# Altium project datalogger.PrjPcb (part 1 of 2)
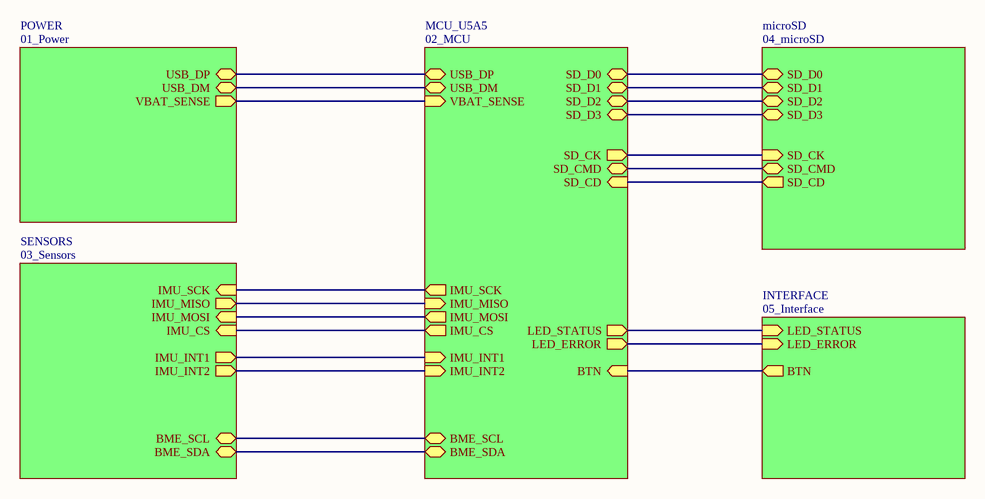
[diagram p0: 00_Top.SchDoc]
6 sheets, 74 parts. Net scope: hierarchical (ports join the sheet entries above them; power ports are global).
Board file: PCB_A1.PcbDoc
Sheets:
  00_Top.SchDoc
    MCU_U5A5 = 02_MCU.SchDoc
    microSD = 04_microSD.SchDoc
    INTERFACE = 05_Interface.SchDoc
    SENSORS = 03_Sensors.SchDoc
    POWER = 01_Power.SchDoc

## Sheet 00_Top.SchDoc
size A4; SheetNumber: 1; SheetTotal: 6

### Sub-sheets
INTERFACE = 05_Interface: LED_STATUS (in), LED_ERROR (in), BTN (out)
MCU_U5A5 = 02_MCU: LED_STATUS (out), LED_ERROR (out), BTN (in), SD_D0 (bidir), SD_D1 (bidir), SD_D2 (bidir), SD_D3 (bidir), SD_CK (out), SD_CMD (bidir), SD_CD (in), BME_SDA (bidir), BME_SCL (bidir), USB_DP (bidir), USB_DM (bidir), VBAT_SENSE (in), IMU_SCK (out), IMU_MISO (in), IMU_MOSI (out), IMU_CS (out), IMU_INT1 (in), IMU_INT2 (in)
microSD = 04_microSD: SD_D0 (bidir), SD_D1 (bidir), SD_D2 (bidir), SD_D3 (bidir), SD_CK (in), SD_CMD (bidir), SD_CD (out)
POWER = 01_Power: USB_DP (bidir), USB_DM (bidir), VBAT_SENSE (out)
SENSORS = 03_Sensors: BME_SDA (bidir), BME_SCL (bidir), IMU_INT2 (out), IMU_INT1 (out), IMU_CS (in), IMU_MOSI (in), IMU_SCK (in), IMU_MISO (out)

### Nets
BME_SCL: sheet MCU_U5A5/BME_SCL, sheet SENSORS/BME_SCL
BME_SDA: sheet MCU_U5A5/BME_SDA, sheet SENSORS/BME_SDA
BTN: sheet MCU_U5A5/BTN, sheet INTERFACE/BTN
IMU_CS: sheet MCU_U5A5/IMU_CS, sheet SENSORS/IMU_CS
IMU_INT1: sheet MCU_U5A5/IMU_INT1, sheet SENSORS/IMU_INT1
IMU_INT2: sheet MCU_U5A5/IMU_INT2, sheet SENSORS/IMU_INT2
IMU_MISO: sheet MCU_U5A5/IMU_MISO, sheet SENSORS/IMU_MISO
IMU_MOSI: sheet MCU_U5A5/IMU_MOSI, sheet SENSORS/IMU_MOSI
IMU_SCK: sheet MCU_U5A5/IMU_SCK, sheet SENSORS/IMU_SCK
LED_ERROR: sheet MCU_U5A5/LED_ERROR, sheet INTERFACE/LED_ERROR
LED_STATUS: sheet MCU_U5A5/LED_STATUS, sheet INTERFACE/LED_STATUS
SD_CD: sheet MCU_U5A5/SD_CD, sheet microSD/SD_CD
SD_CK: sheet MCU_U5A5/SD_CK, sheet microSD/SD_CK
SD_CMD: sheet MCU_U5A5/SD_CMD, sheet microSD/SD_CMD
SD_D0: sheet MCU_U5A5/SD_D0, sheet microSD/SD_D0
SD_D1: sheet MCU_U5A5/SD_D1, sheet microSD/SD_D1
SD_D2: sheet MCU_U5A5/SD_D2, sheet microSD/SD_D2
SD_D3: sheet MCU_U5A5/SD_D3, sheet microSD/SD_D3
USB_DM: sheet MCU_U5A5/USB_DM, sheet POWER/USB_DM
USB_DP: sheet MCU_U5A5/USB_DP, sheet POWER/USB_DP
VBAT_SENSE: sheet MCU_U5A5/VBAT_SENSE, sheet POWER/VBAT_SENSE

## Sheet 02_MCU.SchDoc
size A4; SheetNumber: 3; SheetTotal: 6
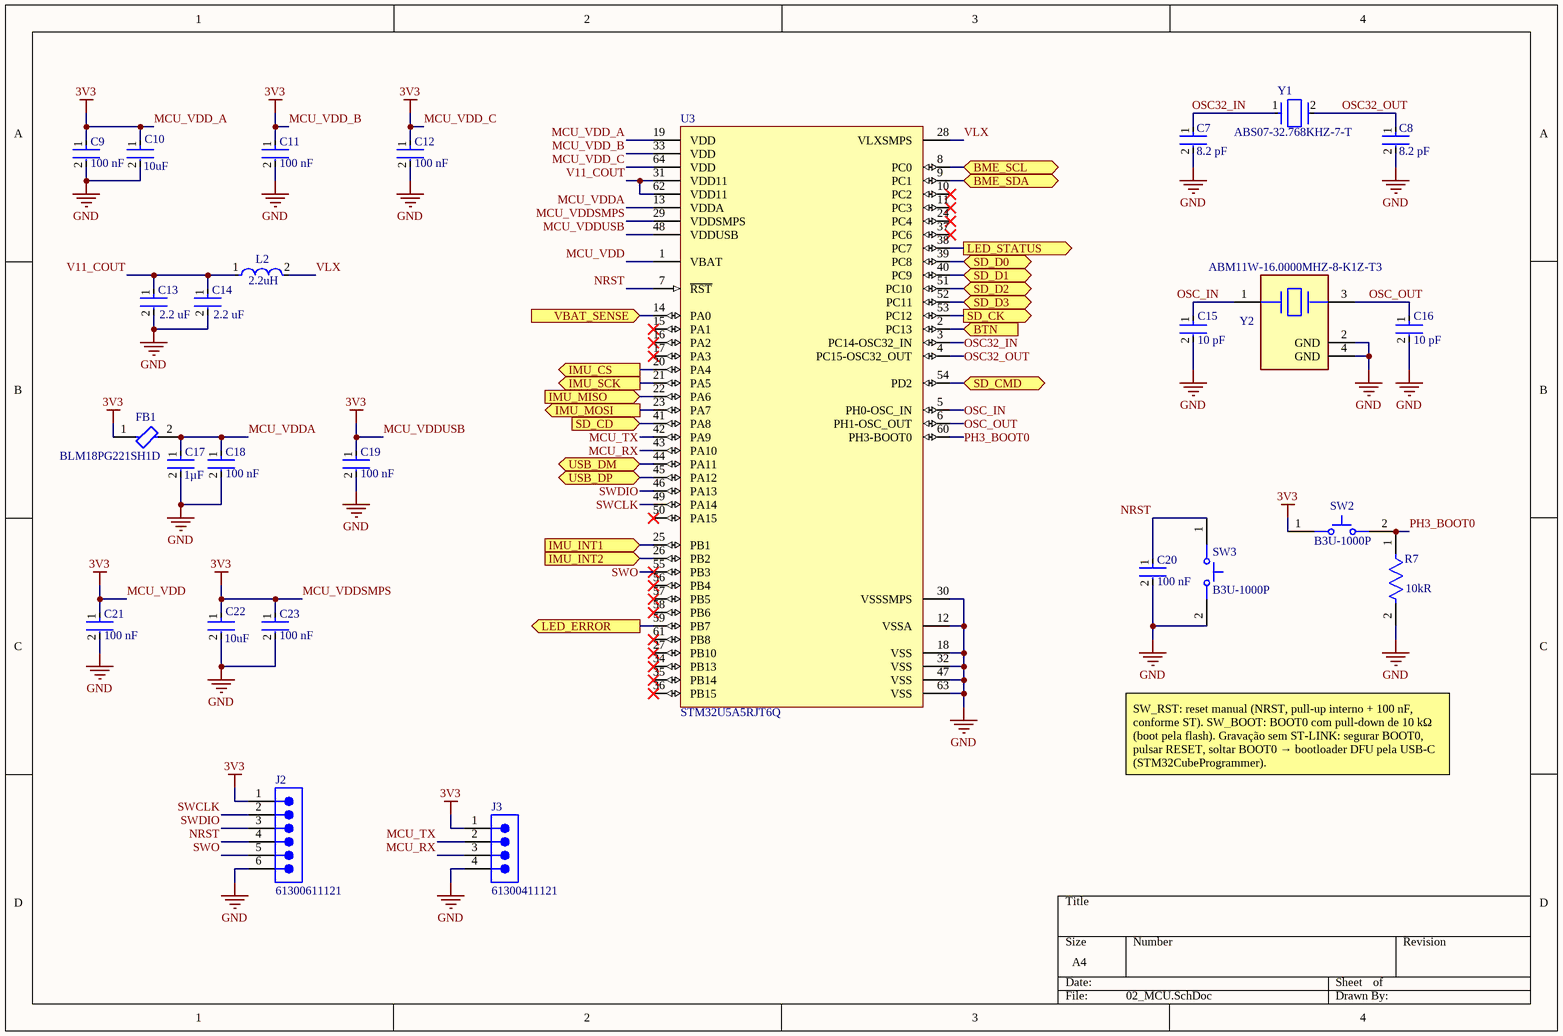
[diagram p1: 02_MCU.SchDoc]

### Parts
C7  value 8.2 pF  [FP-C0402-BB-MFG]  (hidden comment: C0402C829D5GACTU)
C8  value 8.2 pF  [FP-C0402-BB-MFG]  (hidden comment: C0402C829D5GACTU)
C9  Capacitance: 100 nF  [FP-CC0603-DA-MFG]  (hidden comment: CC0603KRX7R9BB104)
C10  value 10uF  [FP-GRM21B-0_2-e0_2_0_7-IPC_B]  (hidden comment: GRM21BZ71E106KE15K)
C11  Capacitance: 100 nF  [FP-CC0603-DA-MFG]  (hidden comment: CC0603KRX7R9BB104)
C12  Capacitance: 100 nF  [FP-CC0603-DA-MFG]  (hidden comment: CC0603KRX7R9BB104)
C13  value 2.2 uF  [FP-CC0603-DA-MFG]  (hidden comment: CC0603KRX7R7BB225)
C14  value 2.2 uF  [FP-CC0603-DA-MFG]  (hidden comment: CC0603KRX7R7BB225)
C15  value 10 pF  [FP-C0402-BB-MFG]  (hidden comment: C0402C100C5GACTU)
C16  value 10 pF  [FP-C0402-BB-MFG]  (hidden comment: C0402C100C5GACTU)
C17  Capacitance: 1µF  [FP-GCM188-0_1-MFG]  (hidden comment: GCM188R71E105KA64D)
C18  Capacitance: 100 nF  [FP-CC0603-DA-MFG]  (hidden comment: CC0603KRX7R9BB104)
C19  Capacitance: 100 nF  [FP-CC0603-DA-MFG]  (hidden comment: CC0603KRX7R9BB104)
C20  Capacitance: 100 nF  [FP-CC0603-DA-MFG]  (hidden comment: CC0603KRX7R9BB104)
C21  Capacitance: 100 nF  [FP-CC0603-DA-MFG]  (hidden comment: CC0603KRX7R9BB104)
C22  value 10uF  [FP-GRM21B-0_2-e0_2_0_7-IPC_B]  (hidden comment: GRM21BZ71E106KE15K)
C23  Capacitance: 100 nF  [FP-CC0603-DA-MFG]  (hidden comment: CC0603KRX7R9BB104)
FB1  BLM18PG221SH1D  [FP-BLM18-0_15-t0_8-IPC_C]
J2  61300611121  [61300611121]
J3  61300411121  [61300411121]
L2  Inductance: 2.2uH  [FP-LQM21PH_G0-IPC_C]  (hidden comment: LQM21PN2R2MGHL)
R7  Resistance: 10kR  [FP-RC0603-0_55-IPC_C]  (hidden comment: RC0603FR-0710KL)
SW2  B3U-1000P  [OMRON-B3U-1000_V]
SW3  B3U-1000P  [OMRON-B3U-1000_V]
U3  STM32U5A5RJT6Q  [LQFP64-5W_MFG]
Y1  ABS07-32.768KHZ-7-T  [FP-ABS07-MFG]
Y2  ABM11W-16.0000MHZ-8-K1Z-T3  [FP-ABM11W-MFG]

### Ports
BME_SCL (bidir, see 00_Top[2C], 03_Sensors[3C]), BME_SDA (bidir, see 00_Top[2C], 03_Sensors[3D]), BTN (in, see 00_Top[3C], 05_Interface[3B]), IMU_CS (out, see 00_Top[2B], 03_Sensors[2B]), IMU_INT1 (in, see 00_Top[2C], 03_Sensors[2B]), IMU_INT2 (in, see 00_Top[2C], 03_Sensors[2B]), IMU_MISO (in, see 00_Top[2B], 03_Sensors[3A]), IMU_MOSI (out, see 00_Top[2B], 03_Sensors[3B]), IMU_SCK (out, see 00_Top[2B], 03_Sensors[3B]), LED_ERROR (out, see 00_Top[3C], 05_Interface[1B]), LED_STATUS (out, see 00_Top[3B], 05_Interface[1C]), SD_CD (in, see 00_Top[3B], 04_microSD[3B]), SD_CK (out, see 00_Top[3B], 04_microSD[2B]), SD_CMD (bidir, see 00_Top[3B], 04_microSD[3B]), SD_D0 (bidir, see 00_Top[3A], 04_microSD[3B]), SD_D1 (bidir, see 00_Top[3B], 04_microSD[3B]), SD_D2 (bidir, see 00_Top[3B], 04_microSD[3B]), SD_D3 (bidir, see 00_Top[3B], 04_microSD[3B]), USB_DM (bidir, see 00_Top[2B], 01_Power[2C]), USB_DP (bidir, see 00_Top[2A], 01_Power[2D]), VBAT_SENSE (in, see 00_Top[2B], 01_Power[4B])

### Nets
3V3: C9.1 C10.1 C11.1 C12.1 C19.1 C21.1 C22.1 C23.1 FB1.1 J2.1 J3.1 SW2.1 U3.1(VBAT) U3.19(VDD) U3.29(VDDSMPS) U3.33(VDD) U3.48(VDDUSB) U3.64(VDD)  [also labelled MCU_VDD, MCU_VDD_A, MCU_VDD_B, MCU_VDD_C, MCU_VDDSMPS, MCU_VDDUSB]
GND: C7.2 C8.2 C9.2 C10.2 C11.2 C12.2 C13.2 C14.2 C15.2 C16.2 C17.2 C18.2 C19.2 C20.2 C21.2 C22.2 C23.2 J2.6 J3.4 R7.2 SW3.2 U3.12(VSSA) U3.18(VSS) U3.30(VSSSMPS) U3.32(VSS) U3.47(VSS) U3.63(VSS) Y2.2(GND) Y2.4(GND)
BME_SCL: U3.8(PC0) ; port BME_SCL
BME_SDA: U3.9(PC1) ; port BME_SDA
BTN: U3.2(PC13) ; port BTN
IMU_CS: U3.20(PA4) ; port IMU_CS
IMU_INT1: U3.25(PB1) ; port IMU_INT1
IMU_INT2: U3.26(PB2) ; port IMU_INT2
IMU_MISO: U3.22(PA6) ; port IMU_MISO
IMU_MOSI: U3.23(PA7) ; port IMU_MOSI
IMU_SCK: U3.21(PA5) ; port IMU_SCK
LED_ERROR: U3.59(PB7) ; port LED_ERROR
LED_STATUS: U3.38(PC7) ; port LED_STATUS
MCU_RX: J3.3 U3.43(PA10)
MCU_TX: J3.2 U3.42(PA9)
MCU_VDDA: C17.1 C18.1 FB1.2 U3.13(VDDA)
NRST: C20.1 J2.4 SW3.1 U3.7(~{RST})
OSC32_IN: C7.1 U3.3(PC14-OSC32_IN) Y1.1
OSC32_OUT: C8.1 U3.4(PC15-OSC32_OUT) Y1.2
OSC_IN: C15.1 U3.5(PH0-OSC_IN) Y2.1
OSC_OUT: C16.1 U3.6(PH1-OSC_OUT) Y2.3
PH3_BOOT0: R7.1 SW2.2 U3.60(PH3-BOOT0)
SD_CD: U3.41(PA8) ; port SD_CD
SD_CK: U3.53(PC12) ; port SD_CK
SD_CMD: U3.54(PD2) ; port SD_CMD
SD_D0: U3.39(PC8) ; port SD_D0
SD_D1: U3.40(PC9) ; port SD_D1
SD_D2: U3.51(PC10) ; port SD_D2
SD_D3: U3.52(PC11) ; port SD_D3
SWCLK: J2.2 U3.49(PA14)
SWDIO: J2.3 U3.46(PA13)
SWO: J2.5 U3.55(PB3)
USB_DM: U3.44(PA11) ; port USB_DM
USB_DP: U3.45(PA12) ; port USB_DP
V11_COUT: C13.1 C14.1 L2.1 U3.31(VDD11) U3.62(VDD11)
VBAT_SENSE: U3.14(PA0) ; port VBAT_SENSE
VLX: L2.2 U3.28(VLXSMPS)

Not connected (* = marked no-connect by the designer): U3 10(PC2)* 11(PC3)* 15(PA1)* 16(PA2)* 17(PA3)* 24(PC4)* 27(PB10)* 34(PB13)* 35(PB14)* 36(PB15)* 37(PC6)* 50(PA15)* 56(PB4)* 57(PB5)* 58(PB6)* 61(PB8)*

### Notes on the sheet
- SW_RST: reset manual (NRST, pull-up interno + 100 nF, conforme ST). SW_BOOT: BOOT0 com pull-down de 10 kΩ (boot pela flash). Gravação sem ST-LINK: segurar BOOT0, pulsar RESET, soltar BOOT0 → bootloader DFU pela USB-C (STM32CubeProgrammer).

### Library data of the parts
C7 C8 = CMP-1034-00609-3: CAP CER 8.2PF 50V C0G/NP0 0402; Manufacturer: Kemet; Temperature Characteristic: C0G; Tolerance: 0.5 pF; Material: Ceramic; Temperature Coefficient: 15%; Voltage Rating: 50 V; Digikey Description: CAP CER 8.2PF 50V C0G/NP0 0402; Category: Cap; Automotive: No; Ipc Land Pattern Name: CAPC10050X50; Device Class L2: Capacitors; Temperature: -55°C to +125°C; ComponentLink2URL: https://content.kemet.com/datasheets/KEM_C1002_X7R_SMD.pdf; Height: 0.55mm; Device Class L1: Passive Components; Mouser Description: Multilayer Ceramic Capacitors MLCC - SMD/SMT 50volts 8.2pF C0G 0.5%; RoHS: TRUE; Temperature Range High: +125°C; Manufacturer Part Number: C0402C829D5GACTU; Package: C0402-BB; Temperature Range Low: -55°C; ComponentLink2Description: Datasheet; Octopart: https://octopart.com/c0402c829d5gactu-kemet-193081; Device Class L3: Ceramic Capacitors; Capacitance: 8.2 pF; Lead Free: Yes
C9 C11 C12 C18-C21 C23 = CMP-2100-03601-2: CAP CER 0.1UF 50V X7R 0603; Manufacturer: YAGEO; Material: Ceramic; Temperature Coefficient: 15%; Tolerance: 0.1; Value: 100 nF; Height: 0.9mm; Voltage: 50 V; ComponentLink2Description: Datasheet; Device Class L2: Capacitors; Temperature Range High: +125°C; Category: Cap; Footprint Url: http://www.yageo.com/exep/pages/download/literatures/UPY-C_GEN_24.pdf; ComponentLink2URL: http://www.yageo.com/documents/recent/UPY-GPHC_X7R_6.3V-to-50V_18.pdf; Package: CC0603-DA; Temperature: -55°C to +125°C; Voltage Rating: 50 V; Temperature Characteristic: X7R; Device Class L1: Passive Components; Temperature Range Low: -55°C; Manufacturer Part Number: CC0603KRX7R9BB104; RoHS: TRUE; Automotive: No; Device Class L3: Ceramic Capacitors; Octopart: https://octopart.com/cc0603krx7r9bb104-yageo-42244635; Mouser Description: Multilayer Ceramic Capacitor, CC Series, 0.1 - F, - 10%, X7R, 50 V, 0603 [1608 Metric]; Lead Free: Yes; Digikey Description: CAP CER 0.1UF 50V X7R 0603
C10 C22 = CMP-06035-042430-1: Chip Multilayer Ceramic Capacitors for General Purpose, 0805, 10uF, X7R, 15%, 10%, 25V; Case/Package: 0805
C13 C14 = CMP-03422-001238-1: CAP CER 2.2UF 16V X7R 0603; Manufacturer: YAGEO; Temperature Coefficient: 15%; Material: Ceramic; Tolerance: 0.1; Voltage: 16 V; Temperature Range High: +125°C; Digikey Description: CAP CER 2.2UF 16V X7R 0603; Temperature: -55°C to +125°C; Lead Free: Yes; Capacitance: 2.2 uF; Package: CC0603-DA; ComponentLink2URL: http://www.yageo.com/documents/recent/UPY-GPHC_X7R_6.3V-to-50V_18.pdf; Device Class L1: Passive Components; Category: Cap; Manufacturer Part Number: CC0603KRX7R7BB225; ComponentLink2Description: Datasheet; Mouser Description: Cap Ceramic 2.2uF 16V X7R 10% Pad SMD 0603 125C Automotive T/R; Device Class L2: Capacitors; RoHS: TRUE; Automotive: No; Voltage Rating: 16 V; Device Class L3: Ceramic Capacitors; Temperature Range Low: -55°C; Height: 0.9mm; Footprint Url: http://www.yageo.com/exep/pages/download/literatures/UPY-C_GEN_24.pdf; Temperature Characteristic: X7R; Octopart: https://octopart.com/cc0603krx7r7bb225-yageo-67146440
C15 C16 = CMP-2008-03045-2: CAP CER 10PF 50V NP0 0402; Manufacturer: Kemet; Material: Ceramic; Temperature Coefficient: 15%; Temperature Characteristic: C0G; Tolerance: 0.25 pF; Category: Cap; Ipc Land Pattern Name: CAPC10050X50; Voltage Rating: 50 V; Automotive: No; Temperature Range High: +125°C; ComponentLink2URL: https://content.kemet.com/datasheets/KEM_C1002_X7R_SMD.pdf; Package: C0402-BB; Capacitance: 10 pF; Temperature: -55°C to +125°C; Height: 0.55mm; Lead Free: Yes; RoHS: TRUE; Mouser Description: Multilayer Ceramic Capacitors MLCC - SMD/SMT 50volts 10pF C0G C0G +/-0.25pF; Octopart: https://octopart.com/c0402c100c5gactu-kemet-125456; Digikey Description: CAP CER 10PF 50V NP0 0402; Device Class L1: Passive Components; Manufacturer Part Number: C0402C100C5GACTU; Device Class L2: Capacitors; Temperature Range Low: -55°C; ComponentLink2Description: Datasheet; Device Class L3: Ceramic Capacitors
C17 = CMP-2006-02363-4: Manufacturer Lifecycle Status: IN PRODUCTION; NexarPartId: 18909256; Dielectric: X7R; Material: Ceramic; Tolerance: 10%; Voltage Rating: 25V; Thickness: 889µm; Max Operating Temperature: 125°C; Radiation Hardening: No; Weight: 6.293594mg; Lead Free: Lead Free; Mount: Surface Mount; Case Code (Imperial): 0603; REACH SVHC: No SVHC; Lifecycle Status: Production; Depth: 800µm; Min Operating Temperature: -55°C; Height: 800µm; Case Code (Metric): 1608; Case/Package: 0603; Voltage: 25V; Packaging: Cut Tape; Length: 1.6mm; Termination: SMD/SMT; Width: 787.4µm; Voltage Rating (DC): 25V; RoHS: Compliant; Schedule B: 8532240020, 8532240020; Ratings: AEC-Q200
FB1 = CMP-06046-000201-1: Chip Ferrite Bead, 0603, 220Ω @ 100MHz, 0.1Ω, 25%, 1.4A; DC Resistance (DCR): 100mR; Impedance: 220R; Number of Lines: 1; Core Material: Ferrite; Mount: Surface Mount; Lead Free: Lead Free; Package Quantity: 4000; Case Code (Imperial): 0603; Current Rating: 1.4A; Height: 0.037inch; Length: 0.063inch; Ratings: AEC-Q200; Max Current Rating: 1.4A; Width: 0.8mm; Tolerance: 25%; Min Operating Temperature: -55°C; Number of Circuits: 1; Termination: SMD/SMT; Max Operating Temperature: 125°C; REACH SVHC: No SVHC; Case Code (Metric): 1608; Depth: 0.95mm; Case/Package: 0603; Packaging: Tape and Reel; Max DC Current: 1.4A; Test Frequency: 100MHz
J2 = CMP-1502-01070-4: THT Vertical Pin Header WR-PHD, Pitch 2.54 mm, Single Row, 6 pins; Pitch: 2.54mm; Operating Supply Voltage: 250V; Connector Type: Male Pin; Gender: Male; Number of Positions: 6; Contact Resistance: 20mΩ; Current Rating: 3A; Termination: Through Hole; Color: Black; Number of Pins: 6; Lead Pitch: 2.54mm; Height: 8.89mm; RoHS: Compliant; Lead Free: Lead Free; Contact Mating Length: 5.9944mm; Contact Plating: Gold; Contact Gender: Male; Packaging: Bulk; Orientation: Vertical; Mount: Through Hole; Voltage Rating: 250V; Number of Rows: 1; Max Operating Temperature: 105°C; Min Operating Temperature: -40°C; Housing Material: PBT; Contact Material: Gold; Number of Contacts: 6
J3 = CMP-1502-01064-4: THT Vertical Pin Header WR-PHD, Pitch 2.54 mm, Single Row, 4 pins; Connector Type: Male Pin; Gender: Male; Current Rating: 3A; Number of Positions: 4; Operating Supply Voltage: 250V; Contact Resistance: 20mΩ; Pitch: 2.54mm; Max Operating Temperature: 105°C; Mount: Through Hole; Contact Material: Gold; Contact Plating: Gold; Number of Contacts: 4; Orientation: Vertical; Packaging: Bulk; Contact Mating Length: 5.9944mm; Voltage Rating: 250V; Number of Rows: 1; Height: 8.89mm; Lead Free: Lead Free; Lead Pitch: 2.54mm; Number of Pins: 4; Color: Black; Min Operating Temperature: -40°C; RoHS: Compliant; Termination: Solder
L2 = CMP-06042-014073-1: Multilayer Type Inductor for Power Lines, 0805 (2012), 2.2μH, 20%, 0.156Ω, 1.7A; Self Resonant Frequency: 40MHz; DC Resistance (DCR): 156mR; Test Frequency: 1MHz; Saturation Current: 450mA; Core Material: Ferrite; Shielding: Shielded; Current Rating: 1.3A; Termination: SMD/SMT; Min Operating Temperature: -40°C; Case Code (Metric): 2012; Mount: Surface Mount; Length: 0.079inch; Package Quantity: 3000; Width: 0.049inch; Max Operating Temperature: 85°C; Weight: 0.000194oz; Height - Seated (Max): 0.039inch; Height: 0.9mm; Tolerance: 20%; Max DC Current: 1.3A; Packaging: Tape and Reel; Case/Package: 0805; Case Code (Imperial): 0805
R7 = CMP-2100-03664-2: RES 10K OHM 1% 1/10W 0603; Voltage Rating: 75V; Voltage Rating (DC): 50V; Power Rating: 100mW; Temperature Coefficient: 100ppm/°C; Depth: 0.8mm; Termination: SMD/SMT; Resistor Type: Thick Film; Series: RC; Construction: Rectangular; Features: Moisture Resistant; Packaging: Tape and Reel; Min Operating Temperature: -55°C; Number of Terminations: 2; Lead Pitch: 0.3mm; RoHS Compliant: Yes; Case/Package: 0603; Resistance Tolerance: 1%; Military Standard: Not; Weight: 7.1E-05oz; Number of Pins: 2; Tolerance: 1%; Length: 1.6mm; Case Code (Imperial): 0603; Lead Free: Lead Free; Width: 0.8mm; Max Power Dissipation: 100mW; Height: 0.45mm; Max Operating Temperature: 155°C; Case Code (Metric): 1608; Size Code: 0603
SW2 SW3 = CMP-011-00000-2: Tactile Switch, SPST-NO, 0.05 A, 12 V, -25 to 70 degC, 2-Pin SMD, RoHS, Tape and Reel; Manufacturer: Omron Electronic Components; IP Rating: IP40; Current Rating: 50mA; Max Contact Resistance: 100mohm; Operating Force: 153gf; Throw Configuration: SPST; Resistance: 0.1Ohm; Max Voltage Rating (DC): 12V; Contact Material: Silver; Max Current Rating: 50mA; Datasheet URL: http://www.omron.com/ecb/products/pdf/en-b3u.pdf; Mounting Technology: SM; Case/Package: B3U-1000; Packaging: TapeandReel; Package Reference: B3U-1000; Manufacturer URL: http://www.omron.com/; Datasheet Version: Jan-15; RoHS Compliant: True; Max Operating Temperature: 70°C; Contact Current Rating: 50mA; Package Quantity: 3500; Package Description: 2-Pin Surface Mount Device, Body 3 x 2.5 mm; Voltage Rating (DC): 12V; Min Operating Temperature: -25°C; Voltage Rating: 12V
U3 = CMP-00355-135308217-1: ARM Microcontrollers - MCU Ultra-low-power FPU Arm Cortex-M33 MCU TrustZone, 160; ComponentLink2Description: Datasheet URL; ComponentLink1Description: Manufacturer's Website; HelpURL: https://www.st.com/resource/en/datasheet/stm32u5a5aj.pdf; Lifecycle Status: Production; ComponentLink1URL: http://www.st.com; ComponentLink2URL: https://www.st.com/resource/en/datasheet/stm32u5a5aj.pdf
Y1 = CMP-27762-014373-1: Crystal 32.768kHz ±20ppm (Tol) 7pF FUND 70kΩ 2-Pin CSMD T/R; Insulation Resistance: 500MR; Series Resistance: 70kR; Mount: Surface Mount; Tolerance: 20ppm; Length: 3.2mm; Lead Free: Lead Free; Frequency: 32.768kHz; Frequency Tolerance: 20ppm; Frequency Stability: 20ppm; Load Capacitance: 7pF; Radiation Hardening: No; Package Quantity: 3000; Width: 1.5mm; Height: 0.9mm; Termination: SMD/SMT; Max Operating Temperature: 85°C; Number of Pins: 2; Operating Frequency: 32.768 kHz; ESR (Equivalent Series Resistance): 70kR; Packaging: Tape and Reel; Series: ABS07; Min Operating Temperature: -40°C; Depth: 1.5mm; Case/Package: CSMD
Y2 = CMP-27762-006513-1: Crystal 16MHz ±10ppm 8pF SMD-4 2mm x 1.6mm; RoHS Compliant: Yes

## Sheet 04_microSD.SchDoc
size A4; SheetNumber: 5; SheetTotal: 6
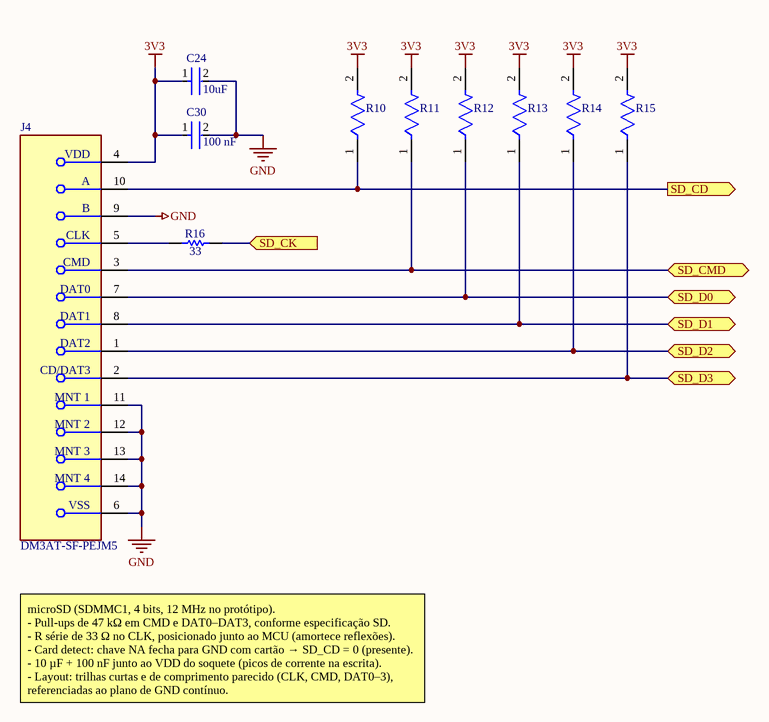
[diagram p2: 04_microSD.SchDoc]

### Parts
C24  value 10uF  [FP-GRM21B-0_2-e0_2_0_7-IPC_B]  (hidden comment: GRM21BZ71E106KE15K)
C30  Capacitance: 100 nF  [FP-CC0603-DA-MFG]  (hidden comment: CC0603KRX7R9BB104)
J4  DM3AT-SF-PEJM5  [FP-DM3AT-SF-PEJM5-MFG]
R10  RC0603FR-0747KL  [FP-RC0603FR-0747KL-MFG]  (value not drawn)
R11  RC0603FR-0747KL  [FP-RC0603FR-0747KL-MFG]  (value not drawn)
R12  RC0603FR-0747KL  [FP-RC0603FR-0747KL-MFG]  (value not drawn)
R13  RC0603FR-0747KL  [FP-RC0603FR-0747KL-MFG]  (value not drawn)
R14  RC0603FR-0747KL  [FP-RC0603FR-0747KL-MFG]  (value not drawn)
R15  RC0603FR-0747KL  [FP-RC0603FR-0747KL-MFG]  (value not drawn)
R16  Resistance: 33  [RESC1608X55X25LL10T15]  (hidden comment: RC0603FR-0733RL)

### Ports
SD_CD (out, see 00_Top[3B], 02_MCU[2B]), SD_CK (in, see 00_Top[3B], 02_MCU[3B]), SD_CMD (bidir, see 00_Top[3B], 02_MCU[3B]), SD_D0 (bidir, see 00_Top[3A], 02_MCU[3B]), SD_D1 (bidir, see 00_Top[3B], 02_MCU[3B]), SD_D2 (bidir, see 00_Top[3B], 02_MCU[3B]), SD_D3 (bidir, see 00_Top[3B], 02_MCU[3B])

### Nets
3V3: C24.1 C30.1 J4.4(VDD) R10.2 R11.2 R12.2 R13.2 R14.2 R15.2
GND: C24.2 C30.2 J4.6(VSS) J4.9(B) J4.11(MNT_1) J4.12(MNT_2) J4.13(MNT_3) J4.14(MNT_4)
SD_CD: J4.10(A) R10.1 ; port SD_CD
SD_CK: R16.2 ; port SD_CK
SD_CMD: J4.3(CMD) R11.1 ; port SD_CMD
SD_D0: J4.7(DAT0) R12.1 ; port SD_D0
SD_D1: J4.8(DAT1) R13.1 ; port SD_D1
SD_D2: J4.1(DAT2) R14.1 ; port SD_D2
SD_D3: J4.2(CD/DAT3) R15.1 ; port SD_D3
NetJ4_5: J4.5(CLK) R16.1

### Notes on the sheet
- microSD (SDMMC1, 4 bits, 12 MHz no protótipo).
  - Pull-ups de 47 kΩ em CMD e DAT0–DAT3, conforme especificação SD.
  - R série de 33 Ω no CLK, posicionado junto ao MCU (amortece reflexões).
  - Card detect: chave NA fecha para GND com cartão → SD_CD = 0 (presente).
  - 10 µF + 100 nF junto ao VDD do soquete (picos de corrente na escrita).
  - Layout: trilhas curtas e de comprimento parecido (CLK, CMD, DAT0–3), referenciadas ao plano de GND contínuo.

### Library data of the parts
C24 = CMP-06035-042430-1: as C10 on sheet 02_MCU; Case/Package: 0805
C30 = CMP-2100-03601-2: as C9 on sheet 02_MCU; Height: 0.9mm; Voltage: 50 V; ComponentLink2Description: Datasheet; Device Class L2: Capacitors; Temperature Range High: +125°C; Category: Cap; Footprint Url: http://www.yageo.com/exep/pages/download/literatures/UPY-C_GEN_24.pdf; ComponentLink2URL: http://www.yageo.com/documents/recent/UPY-GPHC_X7R_6.3V-to-50V_18.pdf; Package: CC0603-DA; Temperature: -55°C to +125°C; Voltage Rating: 50 V; Temperature Characteristic: X7R; Device Class L1: Passive Components; Temperature Range Low: -55°C; Manufacturer Part Number: CC0603KRX7R9BB104; RoHS: TRUE; Automotive: No; Device Class L3: Ceramic Capacitors; Octopart: https://octopart.com/cc0603krx7r9bb104-yageo-42244635; Mouser Description: Multilayer Ceramic Capacitor, CC Series, 0.1 - F, - 10%, X7R, 50 V, 0603 [1608 Metric]; Lead Free: Yes; Digikey Description: CAP CER 0.1UF 50V X7R 0603
J4 = CMP-2000-05150-2: CONN MICRO SD CARD PUSH-PUSH R/A; Current Rating: 500mA; Number of Contacts: 8; Pitch: 1.1mm; Gender: Female; Connector Type: Connector; Max Voltage Rating (AC): 125V; Min Operating Temperature: -25°C; Length: 15.95mm; Packaging: Tape and Reel; Width: 13.85mm; Flammability Rating: UL94 V-0; Termination: SMD/SMT; Contact Material: Copper Alloy; Depth: 15.95mm; Radiation Hardening: No; Number of Rows: 1; Max Operating Temperature: 85°C; Housing Material: Polymer; Height: 1.68mm; Package Quantity: 1; Orientation: Right Angle; REACH SVHC: No SVHC; Mount: Surface Mount; Max Current Rating: 500mA; Number of Positions: 8; Lead Free: Lead Free; Contact Plating: Gold; Voltage Rating: 125V
R10-R15 = CMP-1659-00055-2: RES SMD 47K OHM 1% 1/10W 0603; Voltage Rating: 50V; Temperature Coefficient: 100ppm/°C; Max Power Dissipation: 100mW; Resistance: 47kR; Voltage Rating (DC): 50V; Min Operating Temperature: -55°C; Packaging: Tape and Reel; Features: Moisture Resistant; Termination: SMD/SMT; Technology: THICK FILM; Lead Free: Lead Free; Max Operating Temperature: 155°C; Width: 0.031inch; Case Code (Metric): 1608; Tolerance: 1%; Package Quantity: 1; Resistor Type: Thick Film; RoHS Compliant: Yes; Case/Package: 0603; Case Code (Imperial): 0603; Resistance Tolerance: 1%; Length: 0.063inch; Series: RC; Number of Pins: 2; Power Rating: 100mW; Number of Terminations: 2; Construction: Rectangular; Height: 0.022inch; Military Standard: Not; Size Code: 0603; Depth: 0.8mm
R16 = CMP-2000-06939-1: Chip Resistor, 33 Ohm, +/- 1%, 0.1 W, -55 to 155 degC, 0603 (1608 Metric), RoHS, Tape and Reel; Temperature Coefficient: 100PPM/C; Voltage Rating: 75V; Unit Weight: 0.000071oz; Power Rating: 100mW; Brand: Yageo; Product Category: ThickFilmResistors; Packaging: Reel; Tolerance: 1%; RoHS: True; Height: 0.45mm; Case Code - mm: 1608; Series: RC; Datasheet URL: http://www.yageo.com/documents/recent/PYu-RC_Group_51_RoHS_L_7.pdf; Operating Temperature Range: -55Cto+155C; Type: GeneralPurposeChipResistorSurfaceMount; Product: ThickFilmResistorsGeneralPurpose; Package / Case: 0603(1608metric); Width: 0.8mm; Length: 1.6mm; Case Code - in: 0603; Mounting Technology: SurfaceMount; Manufacturer URL: http://www.yageo.com/; Manufacturer: Yageo; Package Reference: 0603; Termination Style: SMD/SMT; Datasheet Version: Rev. 7, 05/2017; Package Description: 2-Pin Surface Mount Device, Body 1.6 x 0.8 mm

## Sheet 05_Interface.SchDoc
size A4; SheetNumber: 6; SheetTotal: 6
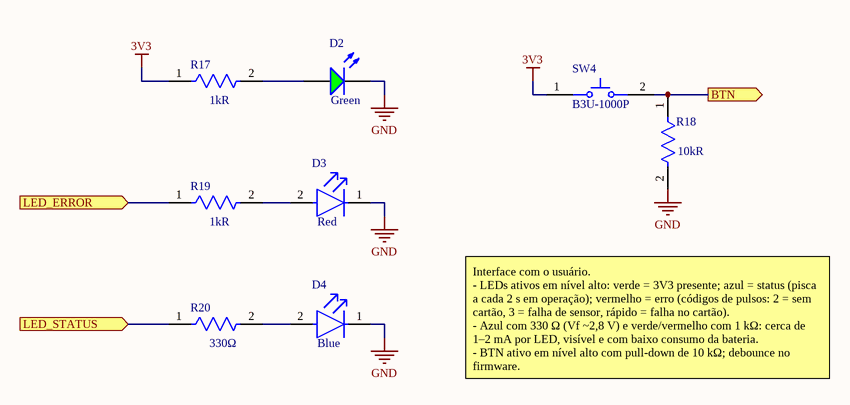
[diagram p3: 05_Interface.SchDoc]

### Parts
D2  Color: Green  [KING-APT1608SGC_V]  (hidden comment: APT1608SGC)
D3  Color: Red  [FP-APT1608EC-MFG]  (hidden comment: APT1608EC)
D4  Color: Blue  [FP-APT1608QBC-D-MFG]  (hidden comment: APT1608QBC/D)
R17  Resistance: 1kR  [FP-RC0603-0_55-IPC_C]  (hidden comment: RC0603FR-071KL)
R18  Resistance: 10kR  [FP-RC0603-0_55-IPC_C]  (hidden comment: RC0603FR-0710KL)
R19  Resistance: 1kR  [FP-RC0603-0_55-IPC_C]  (hidden comment: RC0603FR-071KL)
R20  value 330Ω  [FP-RT0603-MFG]  (hidden comment: RT0603FRE07330RL)
SW4  B3U-1000P  [OMRON-B3U-1000_V]

### Ports
BTN (out, see 00_Top[3C], 02_MCU[3B]), LED_ERROR (in, see 00_Top[3C], 02_MCU[2C]), LED_STATUS (in, see 00_Top[3B], 02_MCU[3A])

### Nets
3V3: R17.1 SW4.1
GND: D2.2(K) D3.1(C) D4.1(C) R18.2
BTN: R18.1 SW4.2 ; port BTN
LED_ERROR: R19.1 ; port LED_ERROR
LED_STATUS: R20.1 ; port LED_STATUS
NetD2_1: D2.1(A) R17.2
NetD3_2: D3.2(A) R19.2
NetD4_2: D4.2(A) R20.2

### Notes on the sheet
- Interface com o usuário.
  - LEDs ativos em nível alto: verde = 3V3 presente; azul = status (pisca a cada 2 s em operação); vermelho = erro (códigos de pulsos: 2 = sem cartão, 3 = falha de sensor, rápido = falha no cartão).
  - Azul com 330 Ω (Vf ~2,8 V) e verde/vermelho com 1 kΩ: cerca de 1–2 mA por LED, visível e com baixo consumo da bateria.
  - BTN ativo em nível alto com pull-down de 10 kΩ; debounce no firmware.

### Library data of the parts
D2 = CMP-2000-05789-1: Super Bright Green LED, 62.5 mW, 25 mA, -40 to 85 degC, 2-Pin SMD, RoHS, Tape and Reel; Manufacturer: Kingbright; Online Catalog: 0603RectanglewithFlatTopChipLEDs; Wavelength - Dominant: 568nm; Wavelength - Peak: 565nm; Voltage - Forward (Vf) (Typ): 2.2V; Lens Type: Clear; Other Names: 754-1121-2; Millicandela Rating: 15mcd; Catalog Drawings: APT1608SeriesTop / APT1608SeriesSide; Lens Style/Size: RectanglewithFlatTop,1.2mmx0.8mm; Current - Test: 20mA; 3D Model: APT1608x.sldprt / APT1608x.pro / APT1608x.igs / APT1608x.stp; Viewing Angle: 120°; Package / Case: 0603(1608Metric); Category: Optoelectronics; Package Description: 2-Pin Surface Mount Device, Body 0.8 x 1.6 mm; Mounting Type: SurfaceMount; Height: 0.75mm; Datasheet Version: Rev. 16B, 02/2012; Family: LEDIndication-Discrete; Manufacturer URL: http://www.kingbright.com/; Package Reference: APT1608SGC; Datasheet URL: https://datasheet.ciiva.com/2113/apt1608sgc-2113808.pdf; Mounting Technology: SurfaceMount; Packaging: Tape&Reel(TR); Standard Package: 2,000; Size / Dimension: 1.60mmLx0.80mmW
D3 = CMP-2000-05179-2: LED RED CLEAR CHIP SMD; Wavelength: 625nm; Forward Voltage: 2V; Forward Current: 20mA; Luminous Intensity: 12mcd; Number of LEDs: 1; Viewing Angle: 120°; Lens Style: Clear; Package Quantity: 2000; Illumination Color: Red; Length: 1.6mm; Case Code (Metric): 1608; Max Operating Temperature: 85°C; Lens Color: Clear; Case/Package: 0603; Test Current: 20mA; Number of Pins: 2; Lead Free: Lead Free; Min Operating Temperature: -40°C; Mount: Surface Mount; Dominant Wavelength: 625nm; Width: 0.8mm; Case Code (Imperial): 0603; Packaging: Tape and Reel; Height: 0.75mm
D4 = CMP-2000-05788-2: LED BLUE CLEAR CHIP SMD; Lens Style: Flat; Forward Current: 20mA; Luminous Intensity: 100mcd; Number of LEDs: 1; Dominant Wavelength: 465nm; Lens Color: Colorless; Forward Voltage: 3.3V; Viewing Angle: 120°; Case Code (Imperial): 0603; Number of Pins: 2; Length: 1.6mm; Mount: Surface Mount; Width: 0.8mm; Height: 0.75mm; Case/Package: 0603; Lead Free: Lead Free; Case Code (Metric): 1608; Lens Transparency: Clear; Min Operating Temperature: -40°C; Packaging: Tape and Reel; Max Operating Temperature: 85°C; Package Quantity: 2000; Test Current: 20mA; Illumination Color: Blue
R17 R19 = CMP-1659-00009-5: RES 1K OHM 1% 1/10W 0603; Voltage Rating: 50V; Power Rating: 100mW; Temperature Coefficient: 100ppm/°C; Military Standard: Not; REACH SVHC: No SVHC; Size Code: 0603; Features: Moisture Resistant; Number of Terminations: 2; Technology: THICK FILM; Series: RC; Case Code (Metric): 1608; Resistance Tolerance: 1%; Resistor Type: Thick Film; Termination: SMD/SMT; Contact Plating: Tin; Radiation Hardening: No; Min Operating Temperature: -55°C; Max Operating Temperature: 155°C; Packaging: Tape and Reel; Max Power Dissipation: 100mW; RoHS Compliant: Yes; Height: 0.45mm; Lead Free: Lead Free; Case/Package: 0603; Length: 1.6mm; Tolerance: 1%; Case Code (Imperial): 0603; Construction: Rectangular; Depth: 0.8mm
R18 = CMP-2100-03664-2: as R7 on sheet 02_MCU; Depth: 0.8mm; Termination: SMD/SMT; Resistor Type: Thick Film; Series: RC; Construction: Rectangular; Features: Moisture Resistant; Packaging: Tape and Reel; Min Operating Temperature: -55°C; Number of Terminations: 2; Lead Pitch: 0.3mm; RoHS Compliant: Yes; Case/Package: 0603; Resistance Tolerance: 1%; Military Standard: Not; Weight: 7.1E-05oz; Number of Pins: 2; Tolerance: 1%; Length: 1.6mm; Case Code (Imperial): 0603; Lead Free: Lead Free; Width: 0.8mm; Max Power Dissipation: 100mW; Height: 0.45mm; Max Operating Temperature: 155°C; Case Code (Metric): 1608; Size Code: 0603
R20 = CMP-03412-006947-1: RES SMD 330 OHM 1% 1/10W 0603; Manufacturer: Yageo; Voltage Rating: 75V; Tolerance: 0.01; Temperature Coefficient: 50 ppm/°C; Power Rating: 0.1W; Composition: Thin Film; Automotive: No; ComponentLink2Description: Datasheet; Package: RT0603; Octopart: https://octopart.com/rt0603fre07330rl-yageo-39844739; Ipc Land Pattern Name: RESC16080X45; Footprint Url: http://www.yageo.com/exep/pages/download/literatures/PYu-R_Mount_10.pdf; Lead Free: Yes; Category: Res; Series: RT; Manufacturer Part Number: RT0603FRE07330RL; Digikey Description: RES SMD 330 OHM 1% 1/10W 0603; Mouser Description: Res Thin Film 0603 330 Ohm 1% 0.1W(1/10W) ???}50ppm/???? Molded SMD Paper T/R; ComponentLink2URL: http://www.yageo.com/documents/recent/PYu-RT_1-to-0.01_RoHS_L_9.pdf; Height: 0.55mm; Temperature: -55°C to +155°C; Temperature Range Low: -55°C; Device Class L2: Resistors; Device Class L1: Passive Components; RoHS: TRUE; Device Class L3: Chip SMD Resistors; Resistance: 330Ω; Temperature Range High: +155°C
SW4 = CMP-011-00000-2: as SW2 on sheet 02_MCU; Contact Material: Silver; Max Current Rating: 50mA; Datasheet URL: http://www.omron.com/ecb/products/pdf/en-b3u.pdf; Mounting Technology: SM; Case/Package: B3U-1000; Packaging: TapeandReel; Package Reference: B3U-1000; Manufacturer URL: http://www.omron.com/; Datasheet Version: Jan-15; RoHS Compliant: True; Max Operating Temperature: 70°C; Contact Current Rating: 50mA; Package Quantity: 3500; Package Description: 2-Pin Surface Mount Device, Body 3 x 2.5 mm; Voltage Rating (DC): 12V; Min Operating Temperature: -25°C; Voltage Rating: 12V

## Sheet 03_Sensors.SchDoc
size A4; SheetNumber: 4; SheetTotal: 6
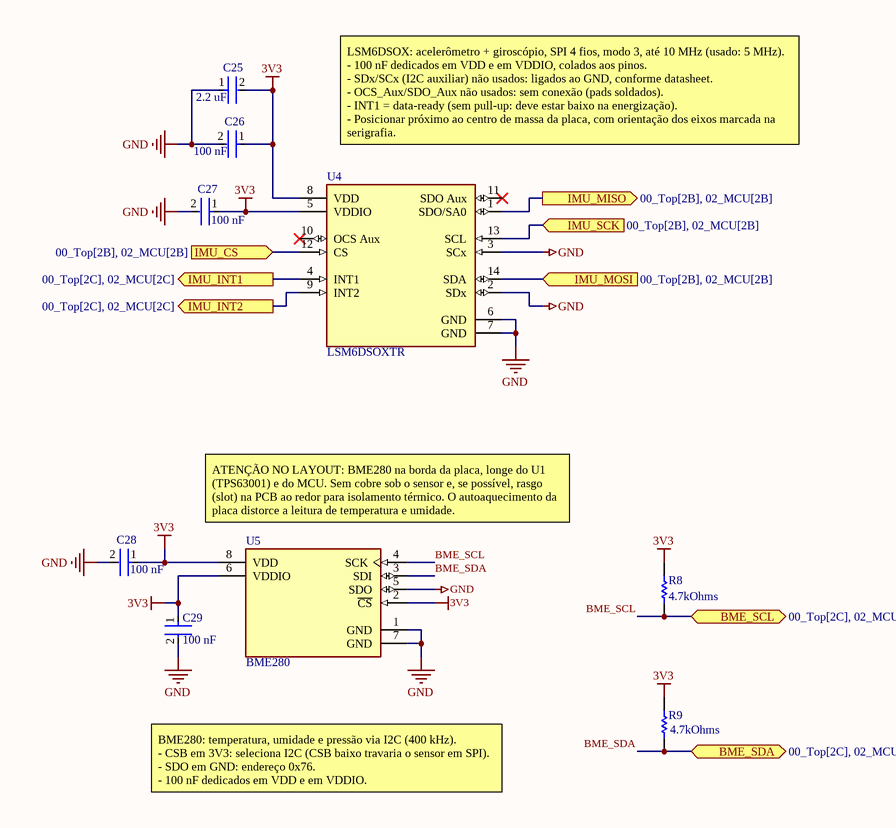
[diagram p4: 03_Sensors.SchDoc, left]

### Parts
C25  value 2.2 uF  [FP-CC0603-DA-MFG]  (hidden comment: CC0603KRX7R7BB225)
C26  Capacitance: 100 nF  [FP-CC0603-DA-MFG]  (hidden comment: CC0603KRX7R9BB104)
C27  Capacitance: 100 nF  [FP-CC0603-DA-MFG]  (hidden comment: CC0603KRX7R9BB104)
C28  Capacitance: 100 nF  [FP-CC0603-DA-MFG]  (hidden comment: CC0603KRX7R9BB104)
C29  Capacitance: 100 nF  [FP-CC0603-DA-MFG]  (hidden comment: CC0603KRX7R9BB104)
R8  Resistance: 4.7kOhms  [RESC1608X55X25LL10T15]  (hidden comment: RC0603FR-074K7L)
R9  Resistance: 4.7kOhms  [RESC1608X55X25LL10T15]  (hidden comment: RC0603FR-074K7L)
U4  LSM6DSOXTR  [FP-LGA-14L-DM00249496-MFG]
U5  BME280  [FP-BME280-MFG]

### Ports
BME_SCL (bidir, see 00_Top[2C], 02_MCU[3A]), BME_SDA (bidir, see 00_Top[2C], 02_MCU[3A]), IMU_CS (in, see 00_Top[2B], 02_MCU[2B]), IMU_INT1 (out, see 00_Top[2C], 02_MCU[2C]), IMU_INT2 (out, see 00_Top[2C], 02_MCU[2C]), IMU_MISO (out, see 00_Top[2B], 02_MCU[2B]), IMU_MOSI (in, see 00_Top[2B], 02_MCU[2B]), IMU_SCK (in, see 00_Top[2B], 02_MCU[2B])

### Nets
3V3: C25.2 C26.1 C27.1 C28.1 C29.1 R8.2 R9.1 U4.5(VDDIO) U4.8(VDD) U5.2(~{CS}) U5.6(VDDIO) U5.8(VDD)
GND: C25.1 C26.2 C27.2 C28.2 C29.2 U4.2(SDx) U4.3(SCx) U4.6(GND) U4.7(GND) U5.1(GND) U5.5(SDO) U5.7(GND)
BME_SCL: R8.1 U5.4(SCK) ; port BME_SCL
BME_SDA: R9.2 U5.3(SDI) ; port BME_SDA
IMU_CS: U4.12(CS) ; port IMU_CS
IMU_INT1: U4.4(INT1) ; port IMU_INT1
IMU_INT2: U4.9(INT2) ; port IMU_INT2
IMU_MISO: U4.1(SDO/SA0) ; port IMU_MISO
IMU_MOSI: U4.14(SDA) ; port IMU_MOSI
IMU_SCK: U4.13(SCL) ; port IMU_SCK

Not connected (* = marked no-connect by the designer): U4 10(OCS_Aux)* 11(SDO_Aux)*

### Notes on the sheet
- LSM6DSOX: acelerômetro + giroscópio, SPI 4 fios, modo 3, até 10 MHz (usado: 5 MHz).
  - 100 nF dedicados em VDD e em VDDIO, colados aos pinos.
  - SDx/SCx (I2C auxiliar) não usados: ligados ao GND, conforme datasheet.
  - OCS_Aux/SDO_Aux não usados: sem conexão (pads soldados).
  - INT1 = data-ready (sem pull-up: deve estar baixo na energização).
  - Posicionar próximo ao centro de massa da placa, com orientação dos eixos marcada na serigrafia.
- (near U5) ATENÇÃO NO LAYOUT: BME280 na borda da placa, longe do U1 (TPS63001) e do MCU. Sem cobre sob o sensor e, se possível, rasgo (slot) na PCB ao redor para isolamento térmico. O autoaquecimento da placa distorce a leitura de temperatura e umidade.
- BME280: temperatura, umidade e pressão via I2C (400 kHz).
  - CSB em 3V3: seleciona I2C (CSB baixo travaria o sensor em SPI).
  - SDO em GND: endereço 0x76.
  - 100 nF dedicados em VDD e em VDDIO.

### Library data of the parts
C25 = CMP-03422-001238-1: as C13 on sheet 02_MCU; Voltage: 16 V; Temperature Range High: +125°C; Digikey Description: CAP CER 2.2UF 16V X7R 0603; Temperature: -55°C to +125°C; Lead Free: Yes; Capacitance: 2.2 uF; Package: CC0603-DA; ComponentLink2URL: http://www.yageo.com/documents/recent/UPY-GPHC_X7R_6.3V-to-50V_18.pdf; Device Class L1: Passive Components; Category: Cap; Manufacturer Part Number: CC0603KRX7R7BB225; ComponentLink2Description: Datasheet; Mouser Description: Cap Ceramic 2.2uF 16V X7R 10% Pad SMD 0603 125C Automotive T/R; Device Class L2: Capacitors; RoHS: TRUE; Automotive: No; Voltage Rating: 16 V; Device Class L3: Ceramic Capacitors; Temperature Range Low: -55°C; Height: 0.9mm; Footprint Url: http://www.yageo.com/exep/pages/download/literatures/UPY-C_GEN_24.pdf; Temperature Characteristic: X7R; Octopart: https://octopart.com/cc0603krx7r7bb225-yageo-67146440
C26-C29 = CMP-2100-03601-2: as C9 on sheet 02_MCU; Height: 0.9mm; Voltage: 50 V; ComponentLink2Description: Datasheet; Device Class L2: Capacitors; Temperature Range High: +125°C; Category: Cap; Footprint Url: http://www.yageo.com/exep/pages/download/literatures/UPY-C_GEN_24.pdf; ComponentLink2URL: http://www.yageo.com/documents/recent/UPY-GPHC_X7R_6.3V-to-50V_18.pdf; Package: CC0603-DA; Temperature: -55°C to +125°C; Voltage Rating: 50 V; Temperature Characteristic: X7R; Device Class L1: Passive Components; Temperature Range Low: -55°C; Manufacturer Part Number: CC0603KRX7R9BB104; RoHS: TRUE; Automotive: No; Device Class L3: Ceramic Capacitors; Octopart: https://octopart.com/cc0603krx7r9bb104-yageo-42244635; Mouser Description: Multilayer Ceramic Capacitor, CC Series, 0.1 - F, - 10%, X7R, 50 V, 0603 [1608 Metric]; Lead Free: Yes; Digikey Description: CAP CER 0.1UF 50V X7R 0603
R8 R9 = CMP-2000-06942-1: Chip Resistor, 4.7 KOhm, +/- 1%, 0.1 W, -55 to 155 degC, 0603 (1608 Metric), RoHS, Tape and Reel; Manufacturer: Yageo; Power Rating: 100mW; Temperature Coefficient: 100PPM/C; Voltage Rating: 50V; Package Reference: 0603; Series: RC; Datasheet Version: Rev. 7, 05/2017; Packaging: Reel; Termination Style: SMD/SMT; Datasheet URL: http://www.yageo.com/documents/recent/PYu-RC_Group_51_RoHS_L_7.pdf; Manufacturer URL: http://www.yageo.com/; Package Description: 2-Pin Surface Mount Device, Body 1.6 x 0.8 mm; Case Code - mm: 1608; Case Code - in: 0603; Mounting Technology: SurfaceMount; Operating Temperature Range: -55Cto+155C; Tolerance: 1%; Product: ThickFilmResistorsGeneralPurpose
U4 = CMP-12177-000010-1: INEMO INERTIAL MODULE: 3D ACCELE; Manufacturer: STMicroelectronics; Sensor Type: Temperature,Accelerometer,Gyroscope; Accel Range: 2/4/8/16g; Accel Sensitivity: 0.061/0.122/0.244/0.488mV/g; Operating Supply Current: 0.55mA; Gyro Range: 125/250/500/1000/2000°/s; Gyro Sensitivity: 4.375/8.75/17.5/35/70LSB/°/s; Sensor Output: I2C,SPI,Other; Min Supply Voltage: 1.62V; Max Supply Voltage: 3.6V; Octopart: https://octopart.com/lsm6dsoxtr-stmicroelectronics-98102600; Package: LGA-14L-DM00249496; Footprint Url: https://www.st.com/content/ccc/resource/technical/document/technical_note/73/17/9c/16/dd/96/4a/01/CD00134799.pdf/files/CD00134799.pdf/jcr:content/translations/en.CD00134799.pdf; ComponentLink2Description: Datasheet; Mouser Description: LSM6DSOX: 3.6 V 3 Axis Accelerometer Gyroscope iNEMO Inertial Module - LGA-14L; ComponentLink2URL: https://www.st.com/resource/en/datasheet/lsm6dsox.pdf; Temperature Range Low: -40°C; Digikey Description: INEMO INERTIAL MODULE: 3D ACCELE; Lead Free: Yes; Device Class L3: Inertial Measurement Units (IMUs); Category: IC; Device Class L2: Motion Sensors; RoHS: TRUE; Temperature: -40°C to +85°C; Height: 0.86mm; Device Class L1: Sensors; Temperature Range High: +85°C; Manufacturer Part Number: LSM6DSOXTR; Automotive: No
U5 = CMP-2000-05073-3: SENSOR PRESSURE HUMIDITY TEMP; Sensor Type: Temperature; Accuracy: 3%; Response Time: 1s; Output Type: SPI; Min Operating Temperature: -40°C; Max Operating Temperature: 85°C; Case/Package: LGA; Packaging: Cut Tape; Mount: Surface Mount; Lead Free: Lead Free; Number of Pins: 8

## Sheet 01_Power.SchDoc
size A4; SheetNumber: 2; SheetTotal: 6
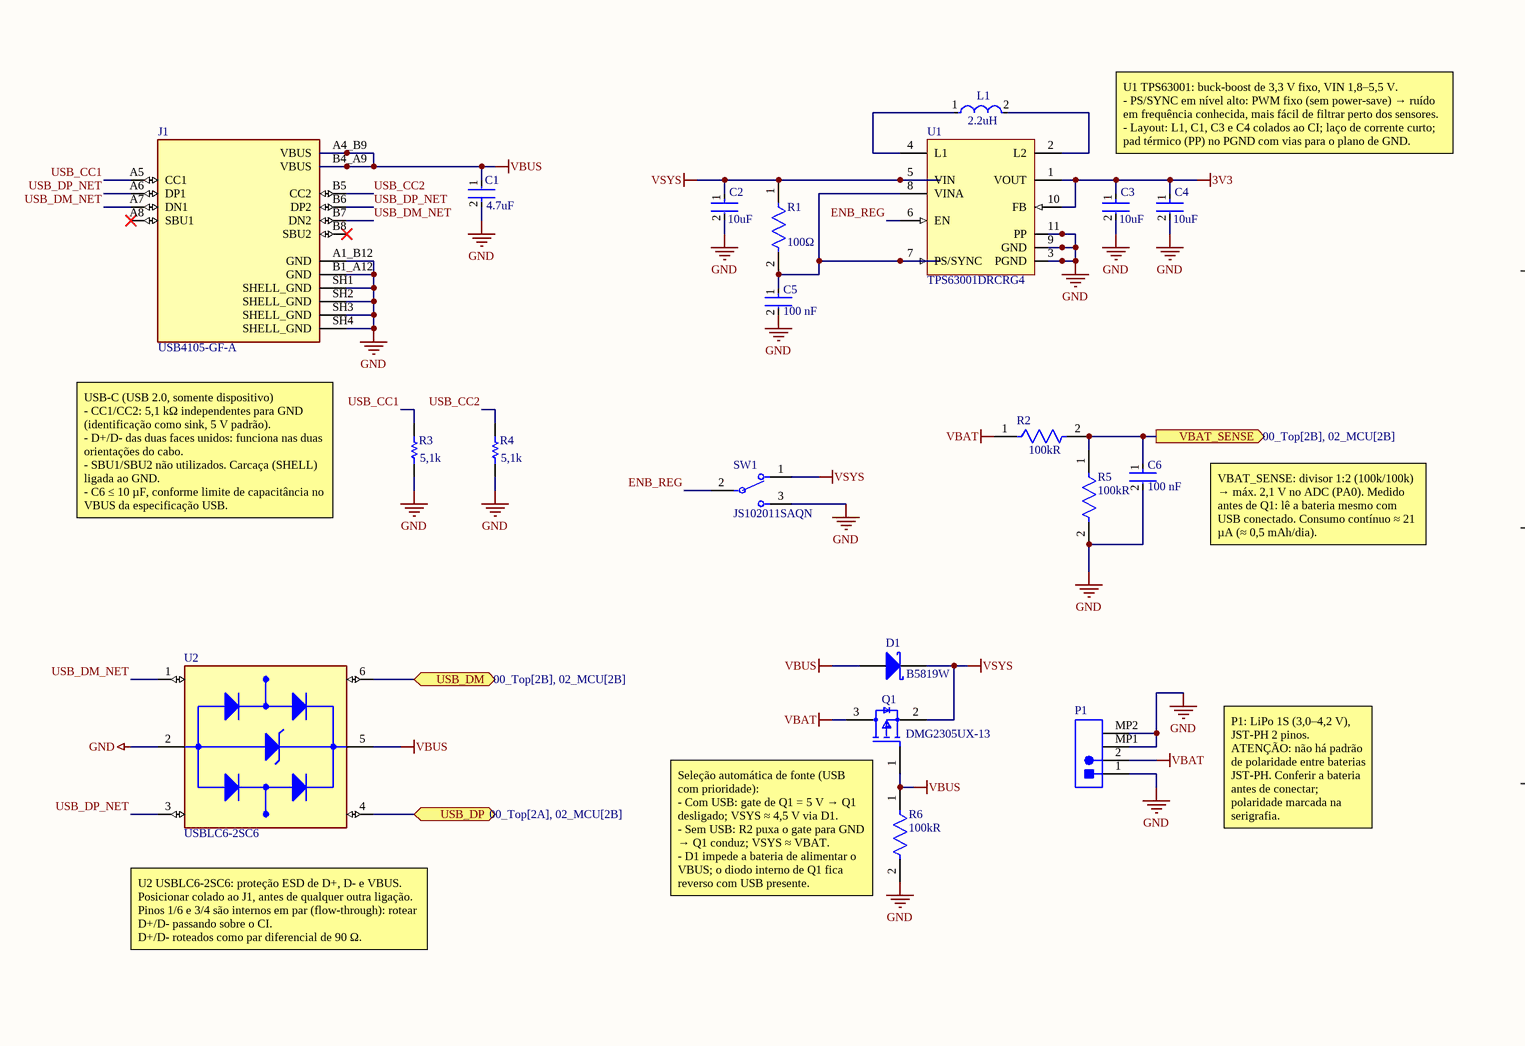
[diagram p5: 01_Power.SchDoc, left]
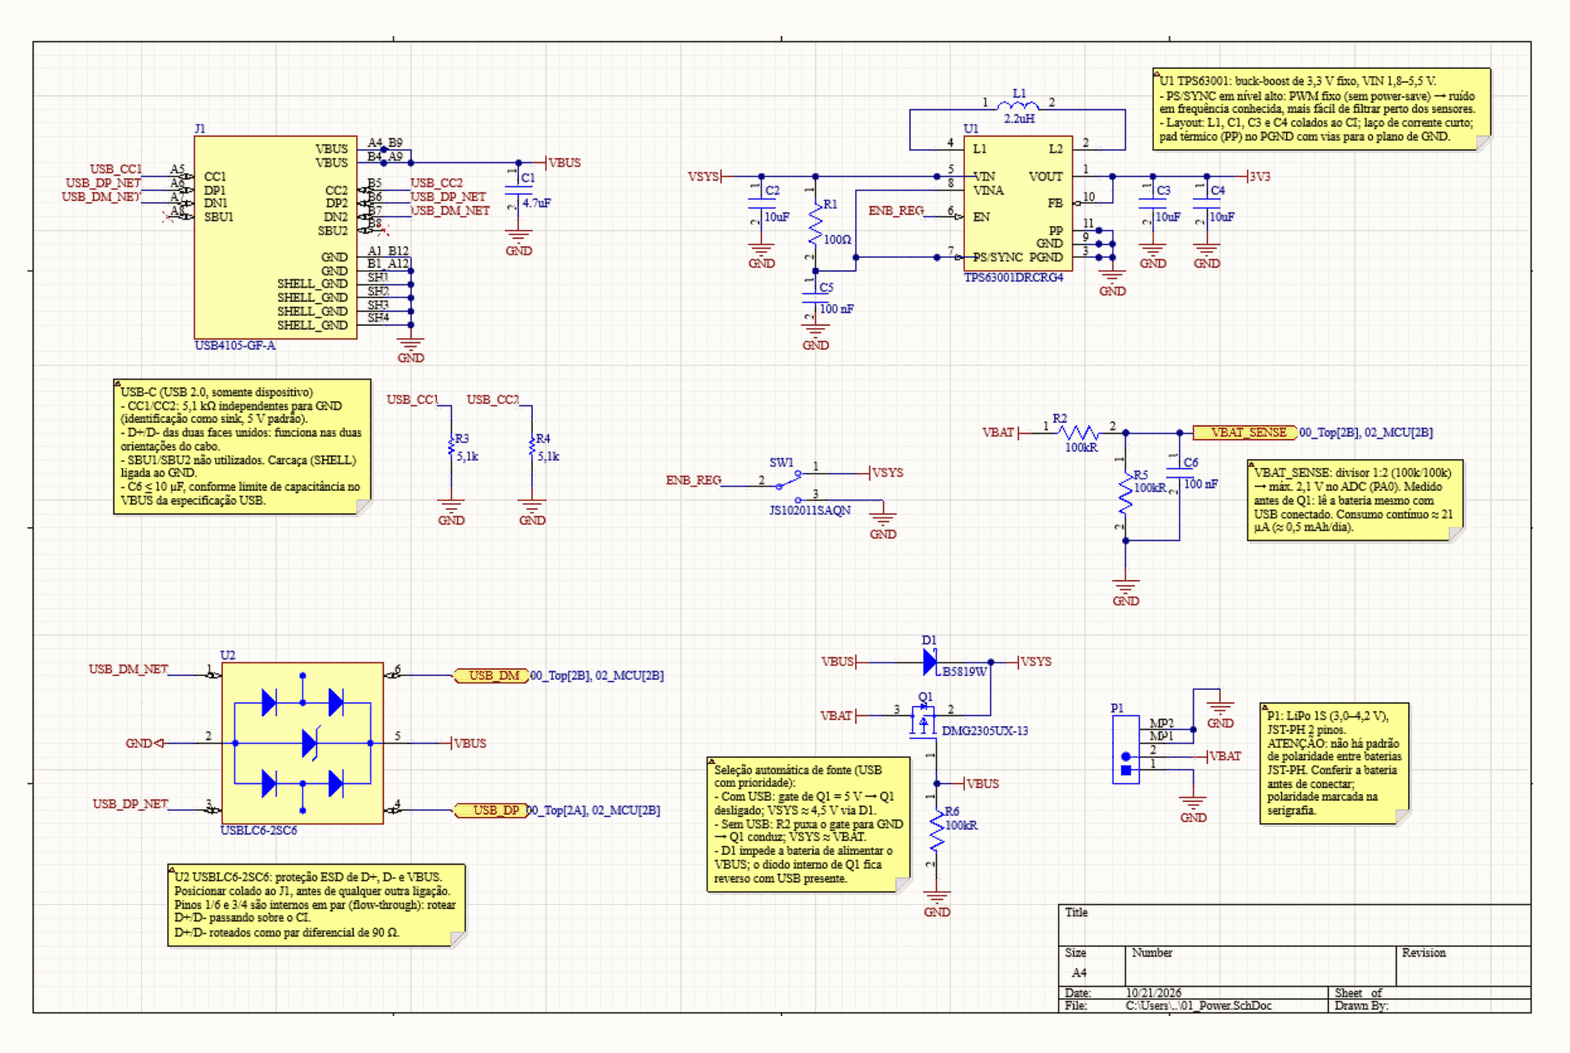
[diagram p6: 01_Power.SchDoc, right]

### Parts
C1  Capacitance: 4.7uF  [FP-GRM219-0_15-0_1-IPC_C]  (hidden comment: GRM219R61E475KA73D)
C2  value 10uF  [FP-GRM21B-0_2-e0_2_0_7-IPC_B]  (hidden comment: GRM21BZ71E106KE15K)
C3  value 10uF  [FP-GRM21B-0_2-e0_2_0_7-IPC_B]  (hidden comment: GRM21BZ71E106KE15K)
C4  value 10uF  [FP-GRM21B-0_2-e0_2_0_7-IPC_B]  (hidden comment: GRM21BZ71E106KE15K)
C5  Capacitance: 100 nF  [FP-CC0603-DA-MFG]  (hidden comment: CC0603KRX7R9BB104)
C6  Capacitance: 100 nF  [FP-CC0603-DA-MFG]  (hidden comment: CC0603KRX7R9BB104)
D1  B5819W  [MCC-SOD123_V]
J1  USB4105-GF-A  [GCT_USB4105-GF-A]
L1  value 2.2uH  [FP-VLS3012HBX-MFG]  (hidden comment: VLS3012HBX-2R2M)
P1  S2B-PH-SM4-TB(LF)(SN)  [JST- S2B-PH-SM4-TB(LF)(SN)-2_V]  (value not drawn)
Q1  DMG2305UX-13  [FP-SOT23-MFG]
R1  Resistance: 100Ω  [FP-RC0603-0_55-MFG]  (hidden comment: RC0603FR-07100RL)
R2  Resistance: 100kR  [FP-RC0603-0_55-MFG]  (hidden comment: RC0603FR-07100KL)
R3  value 5,1k  [RESC1608X55X25ML10T15]  (hidden comment: RC0603FR-075K1L)
R4  value 5,1k  [RESC1608X55X25ML10T15]  (hidden comment: RC0603FR-075K1L)
R5  Resistance: 100kR  [FP-RC0603-0_55-MFG]  (hidden comment: RC0603FR-07100KL)
R6  Resistance: 100kR  [FP-RC0603-0_55-MFG]  (hidden comment: RC0603FR-07100KL)
SW1  JS102011SAQN  [FP-JS102011SAQN-MFG]
U1  TPS63001DRCRG4  [DRC10-2400X1650TP]
U2  USBLC6-2SC6  [SOT95P280X145-6N]

### Ports
USB_DM (bidir, see 00_Top[2B], 02_MCU[2B]), USB_DP (bidir, see 00_Top[2A], 02_MCU[2B]), VBAT_SENSE (out, see 00_Top[2B], 02_MCU[2B])

### Nets
3V3: C3.1 C4.1 U1.1(VOUT) U1.10(FB)
GND: C1.2 C2.2 C3.2 C4.2 C5.2 C6.2 J1.A1_B12(GND) J1.B1_A12(GND) J1.SH1(SHELL_GND) J1.SH2(SHELL_GND) J1.SH3(SHELL_GND) J1.SH4(SHELL_GND) P1.1 P1.MP1 P1.MP2 R3.2 R4.2 R5.2 R6.2 SW1.3 U1.3(PGND) U1.9(GND) U1.11(PP) U2.2(GND)
VBAT: P1.2 Q1.3(D) R2.1
VBUS: C1.1 D1.1(A) J1.A4_B9(VBUS) J1.B4_A9(VBUS) Q1.1(G) R6.1 U2.5(VBUS)
VSYS: C2.1 D1.2(K) Q1.2(S) R1.1 SW1.1 U1.5(VIN)
ENB_REG: SW1.2(C) U1.6(EN)
USB_CC1: J1.A5(CC1) R3.1
USB_CC2: J1.B5(CC2) R4.1
USB_DM: U2.6(I/O1_OUT) ; port USB_DM
USB_DM_NET: J1.A7(DN1) J1.B7(DN2) U2.1(I/O1_IN)
USB_DP: U2.4(I/O2_OUT) ; port USB_DP
USB_DP_NET: J1.A6(DP1) J1.B6(DP2) U2.3(I/O2_IN)
VBAT_SENSE: C6.1 R2.2 R5.1 ; port VBAT_SENSE
NetC5_1: C5.1 R1.2 U1.7(PS/SYNC) U1.8(VINA)
NetL1_1: L1.1 U1.4(L1)
NetL1_2: L1.2 U1.2(L2)

Not connected (* = marked no-connect by the designer): J1 A8(SBU1)* B8(SBU2)*

### Notes on the sheet
- U1 TPS63001: buck-boost de 3,3 V fixo, VIN 1,8–5,5 V.
  - PS/SYNC em nível alto: PWM fixo (sem power-save) → ruído em frequência conhecida, mais fácil de filtrar perto dos sensores.
  - Layout: L1, C1, C3 e C4 colados ao CI; laço de corrente curto; pad térmico (PP) no PGND com vias para o plano de GND.
- USB-C (USB 2.0, somente dispositivo)
  - CC1/CC2: 5,1 kΩ independentes para GND (identificação como sink, 5 V padrão).
  - D+/D- das duas faces unidos: funciona nas duas orientações do cabo.
  - SBU1/SBU2 não utilizados. Carcaça (SHELL) ligada ao GND.
  - C6 ≤ 10 µF, conforme limite de capacitância no VBUS da especificação USB.
- VBAT_SENSE: divisor 1:2 (100k/100k) → máx. 2,1 V no ADC (PA0). Medido antes de Q1: lê a bateria mesmo com USB conectado. Consumo contínuo ≈ 21 µA (≈ 0,5 mAh/dia).
- P1: LiPo 1S (3,0–4,2 V), JST-PH 2 pinos.
  ATENÇÃO: não há padrão de polaridade entre baterias JST-PH. Conferir a bateria antes de conectar; polaridade marcada na serigrafia.
- (near Q1) Seleção automática de fonte (USB com prioridade):
  - Com USB: gate de Q1 = 5 V → Q1 desligado; VSYS ≈ 4,5 V via D1.
  - Sem USB: R2 puxa o gate para GND → Q1 conduz; VSYS ≈ VBAT.
  - D1 impede a bateria de alimentar o VBUS; o diodo interno de Q1 fica reverso com USB presente.
- U2 USBLC6-2SC6: proteção ESD de D+, D- e VBUS.
  Posicionar colado ao J1, antes de qualquer outra ligação.
  Pinos 1/6 e 3/4 são internos em par (flow-through): rotear D+/D- passando sobre o CI.
  D+/D- roteados como par diferencial de 90 Ω.

### Library data of the parts
C1 = CMP-06035-041247-1: Chip Multilayer Ceramic Capacitors for General Purpose, 0805, 4.7uF, X5R, 15%, 10%, 25V; Resistor Type: Ceramic; Weight: 0.000335oz; Mount: Surface Mount; Thickness: 0.037inch; Case Code (Metric): 2012; Packaging: Tape and Reel; Material: Ceramic; Voltage Rating: 25V; Length: 2mm; Package Quantity: 4000; Case/Package: 0805; Height: 0.85mm; Termination: SMD/SMT; Tolerance: 10%; Dielectric: X5R; Width: 1.25mm; Max Operating Temperature: 85°C; Case Code (Imperial): 0805; Min Operating Temperature: -55°C; Voltage Rating (DC): 25V
C2-C4 = CMP-06035-042430-1: as C10 on sheet 02_MCU; Case/Package: 0805
C5 C6 = CMP-2100-03601-2: as C9 on sheet 02_MCU; Height: 0.9mm; Voltage: 50 V; ComponentLink2Description: Datasheet; Device Class L2: Capacitors; Temperature Range High: +125°C; Category: Cap; Footprint Url: http://www.yageo.com/exep/pages/download/literatures/UPY-C_GEN_24.pdf; ComponentLink2URL: http://www.yageo.com/documents/recent/UPY-GPHC_X7R_6.3V-to-50V_18.pdf; Package: CC0603-DA; Temperature: -55°C to +125°C; Voltage Rating: 50 V; Temperature Characteristic: X7R; Device Class L1: Passive Components; Temperature Range Low: -55°C; Manufacturer Part Number: CC0603KRX7R9BB104; RoHS: TRUE; Automotive: No; Device Class L3: Ceramic Capacitors; Octopart: https://octopart.com/cc0603krx7r9bb104-yageo-42244635; Mouser Description: Multilayer Ceramic Capacitor, CC Series, 0.1 - F, - 10%, X7R, 50 V, 0603 [1608 Metric]; Lead Free: Yes; Digikey Description: CAP CER 0.1UF 50V X7R 0603
D1 = CMP-004-00005-2: Schottky Barrier Rectifier, 40 V, 1 A, -65 to 125 degC, 2-Pin SOD123, RoHS, Tape and Reel; Manufacturer: Micro Commercial Components; Datasheet Version: Rev. B, 01/2013; RoHS Compliant: Unknown; Manufacturer URL: http://www.mccsemi.com/; Package URL: http://www.mccsemi.com/up_pdf/1N4448W(SOD-123).pdf; Case/Package: SOD123; Mounting Technology: SM; Datasheet URL: http://www.mccsemi.com/up_pdf/B5817W-B5819W(SOD-123).pdf; Package Description: 2-Pin Small Outline Diode, Body 2.7 x 1.6 mm, Height 1.35 mm; Package Reference: SOD123
J1 = USB4105-GF-A: Conector USB-C 2.0, receptáculo de 16 pinos, montagem SMT/TH; Manufacturer: GCT; Manufacturer Part Number: USB4105-GF-A; Datasheet: https://gct.co/connector/usb4105
L1 = CMP-08253-000022-1: FIXED IND 2.2UH 3.15A 106 MOHM; Manufacturer: TDK; Tolerance: 20%; Shielding: true; Core Material: Metal; Rms Current: 3.35A; Test Frequency: 1MHz; Saturation Current: 3.76A; Series Resistance: 106mΩ; RoHS: TRUE; Octopart: https://octopart.com/vls3012hbx-2r2m-tdk-83930104; Temperature: -40°C to +105°C; Temperature Range High: +105°C; Device Class L2: Inductors; Height: 1.2mm; Temperature Range Low: -40°C; Lead Free: Yes; Digikey Description: FIXED IND 2.2UH 3.15A 106 MOHM; Automotive: No; ComponentLink2Description: Datasheet; Inductance: 2.2uH; Package: VLS3012HBX; Category: Ind; Manufacturer Part Number: VLS3012HBX-2R2M; Composition: Wirewound; ComponentLink2URL: https://product.tdk.com/info/en/catalog/datasheets/inductor_commercial_power_vls3012hbx_en.pdf; Device Class L3: Fixed Inductors; Device Class L1: Passive Components
P1 = CMP-002-00031-2: Male Header, Pitch 2 mm, 1 x 2 Position, Height 5.5 mm, -25 to 85 degC, RoHS, Tape and Reel; Manufacturer: JST; Package Reference: S2B-PH-SM4-TB(LF)(SN)-2; Mounting Technology: SM; Manufacturer URL: http://www.jst.com/home2.html; Package Description: Male Header, Pitch 2 mm, 1 x 2 Position, Height 5.5 mm; Max Operating Temperature: 85°C; Case/Package: S2B-PH-SM4-TB(LF)(SN)-2; Datasheet URL: http://www.jst-mfg.com/product/pdf/eng/ePH.pdf; Connector Type: Header; RoHS Compliant: Unknown; Datasheet Version: Dec-12; Gender: Male; Min Operating Temperature: -25°C
Q1 = CMP-12801-000021-1: MOSFET P-CH 20V 4.2A SOT23; Manufacturer: Diodes Inc.; Input Capacitace At Vds: 808pF @ -15V; Rthja Max: 90°C/W; Drain To Source Voltage: -20V; Standoff Height: 0.013mm; Number Of P Channels: 1; Gate To Source Voltage: 8V; Turn On Delay Time: 10.8ns; Pulse Drain Current: -15A; Threshold Vgs Max: -0.9V; Max Junction Temp: +150°C; Depletion Mode: False; Drain To Source Resistance: 40mΩ; Threshold Vgs Min: -0.5V; Continuous Drain Current: -4.2A; Turn Off Delay Time: 79.3ns; Gate Charge At Vgs: 10.2nC @ -4.5V; Power Dissipation: 1.4W; Digikey Description: MOSFET P-CH 20V 4.2A SOT23; Temperature Range High: +150°C; Height: 1.1mm; Package: SOT23; Footprint Url: https://www.diodes.com/assets/Package-Files/SOT23.pdf; Device Class L3: MOSFETs; RoHS: TRUE; Temperature: -55°C to +150°C; Mouser Description: MOSFET P-Ch ENH FET -20V 52mOhm -5.0V; Temperature Range Low: -55°C; ComponentLink2Description: Datasheet; Manufacturer Part Number: DMG2305UX-13; Octopart: https://octopart.com/dmg2305ux-13-diodes+inc.-29925594; Ipc Land Pattern Name: SOT92P240X102-3; Device Class L2: Transistors; Automotive: No; Number Of Channels: 1; Drain To Source Breakdown Voltage: -20V; Lead Free: Yes; Device Class L1: Discrete Semiconductors; Category: Trans; ComponentLink2URL: https://www.diodes.com/assets/Datasheets/DMG2305UX.pdf
R1 = CMP-2100-03663-2: NexarPartId: 55402879; Voltage Rating: 50V; Power Rating: 100mW; Tolerance: 1%; Temperature Coefficient: 100ppm/°C; Case/Package: 0603; Military Standard: Not; REACH SVHC: Unknown; Case Code (Metric): 0603; Max Operating Temperature: 155°C; Schedule B: 8533210045, 8533210045; Height: 450µm; Length: 1.6mm; Lead Free: Lead Free; Packaging: Tape & Reel; Case Code (Imperial): 0603; Composition: Thick Film; Min Operating Temperature: -55°C; Voltage Rating (DC): 50V; RoHS: Compliant; Depth: 800µm; Number of Pins: 2; Termination: SMD/SMT; Width: 800µm
R2 R5 R6 = CMP-2100-03662-2: RES SMD 100K OHM 1% 1/10W 0603; Voltage Rating (DC): 50V; Max Power Dissipation: 100mW; Temperature Coefficient: 100ppm/°C; Working Voltage: 75V; Length: 1.6mm; Lead Free: Lead Free; Number of Terminations: 2; Packaging: Tape and Reel; Voltage Rating: 50V; Termination: SMD/SMT; Width: 0.8mm; Resistor Type: Thick Film; Resistance Tolerance: 1%; Features: Moisture Resistant; Height: 0.45mm; Construction: Rectangular; Case/Package: 0603; Military Standard: Not; Case Code (Imperial): 0603; Series: RC; Technology: THICK FILM; Depth: 0.8mm; RoHS Compliant: Yes; REACH SVHC: No SVHC; Min Operating Temperature: -55°C; Case Code (Metric): 1608; Max Operating Temperature: 155°C; Power Rating: 100mW; Number of Pins: 2; Tolerance: 1%
R3 R4 = CMP-2000-04091-1: Manufacturer: Yageo; Part Number: RC0603FR-075K1L
SW1 = CMP-2000-06501-2: SWITCH SLIDE SPDT 300MA 6V; Switch Function: On-On; Illumination Type: Non-Illuminated; Switch Travel: 2mm; Contact Resistance: 70mR; Actuator Material: Nylon; Electrical Life: 5000Cycles; Actuator Type: Standard; Max Operating Temperature: 85°C; Housing Material: Nylon; Radiation Hardening: No; Max Voltage Rating (DC): 6V; Package Quantity: 1; Case/Package: 100; Actuator Length: 2mm; Min Operating Temperature: -40°C; Contact Current Rating: 300mA; REACH SVHC: No SVHC; Throw Configuration: SPDT; Packaging: Tape and Reel; Contact Material: Copper Alloy; Max Current Rating: 300mA; Current Rating: 300mA; Mount: Surface Mount; Lead Free: Lead Free; Termination: Gull Wing; Voltage Rating (DC): 6V; Length: 9mm; Orientation: Right Angle; Contact Plating: Silver
U1 = CMP-0345-00003-1: Buck-Boost Voltage Converter with 1.8 to 5.5 V Input and 3.3 V Output, -40 to 85 degC, 10-Pin SON (DRC), Green (RoHS & no Sb/Br); Manufacturer: Texas Instruments; Vin(Min)(V): 1.8; Regulated Outputs(#): 1; Vout(Min)(V): 3.3; Switching Frequency(Max)(kHz): 1500; Iq(Typ)(mA): 0.03; Synchronous Rectification: TRUE; Iout(Max)(A): 1.2; SubFamily: Buck-Boost Regulator; Vin(Max)(V): 5.5; PartNumber: TPS63001DRCRG4; PackageVersion: revL, Sep-2011; ComponentLink1Description: Datasheet; PackageDescription: 10-Pin Plastic Small Outline No-Lead, 3 x 3 x 1 mm Body, 0.5 mm Pitch, Exposed Pad; ComponentLink2URL: http://www.ti.com/litv/pdf/mpds117k; ComponentLink1URL: http://www.ti.com/general/docs/lit/getliterature.tsp?genericPartNumber=TPS63001&fileType=pdf; ComponentLink2Description: Package Specification; Preset Vout(V): 3.3; Topology: Buck-Boost; Eco-Plan: Green (RoHS & no Sb/Br); PackageReference: DRC10-2400X1650TP; Mounting Technology: Surface Mount; DatasheetVersion: SLVS520B; Dynamic Voltage Scaling: TRUE; Vout(Max)(V): 3.3
U2 = USBLC6-2SC6: 17V Clamp 5A (8/20Âµs) Ipp Tvs Diode Surface Mount SOT-23-6; MF: STMicroelectronics; SnapEDA_Link: https://www.snapeda.com/parts/USBLC6-2SC6/STMicroelectronics/view-part/?ref=snap; Check_prices: https://www.snapeda.com/parts/USBLC6-2SC6/STMicroelectronics/view-part/?ref=eda; Purchase-URL: https://pricing.snapeda.com/search/part/USBLC6-2SC6/?ref=eda; Price: None; Availability: In Stock; Package: SOT-23-6 STMicroelectronics; MP: USBLC6-2SC6